# Altium schematic sheet Controller_Sheet.SchDoc
size A4; DocumentNumber: 3; SheetNumber: 3; SheetTotal: 4
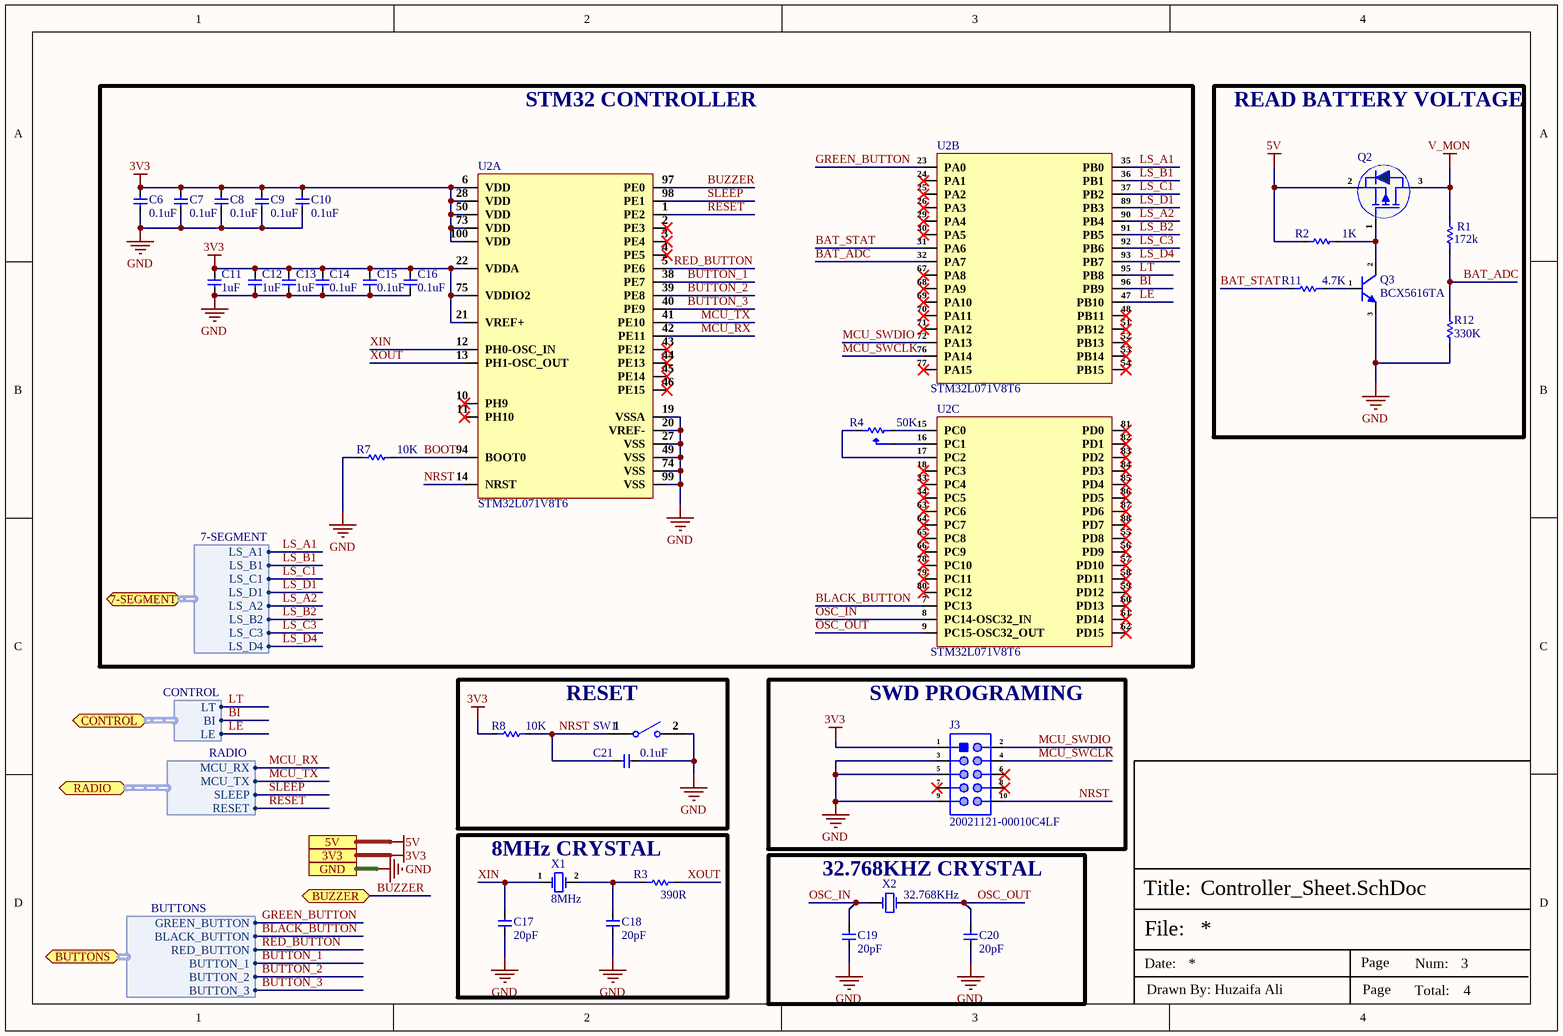
[diagram p0: Controller_Sheet.SchDoc]

## Parts
C6  0.1uF  [Cap-0805]
C7  0.1uF  [Cap-0805]
C8  0.1uF  [Cap-0805]
C9  0.1uF  [Cap-0805]
C10  0.1uF  [Cap-0805]
C11  1uF  [Cap-0805]
C12  1uF  [Cap-0805]
C13  1uF  [Cap-0805]
C14  0.1uF  [Cap-0805]
C15  0.1uF  [Cap-0805]
C16  0.1uF  [Cap-0805]
C17  20pF  [Cap-0805]
C18  20pF  [Cap-0805]
C19  20pF  [Cap-0805]
C20  20pF  [Cap-0805]
C21  0.1uF  [Cap-0805]
J3  20021121-00010C4LF  [20021121-00010C4LF_]
Q2  AO3407  [SOT-23]  (value not drawn)
Q3  BCX5616TA  [SOT-89-3]
R1  172k  [Res-0603]
R2  1K  [Res-0603]
R3  390R  [RES-0805]
R4  50K  [RV4NAYSD503A]
R7  10K  [RES-0805]
R8  10K  [RES-0805]
R11  4.7K  [Res-0603]
R12  330K  [Res-0603]
SW1  B3U-1000P  [B3U-1000P]  (value not drawn)
U2  STM32L071V8T6  [LQFP-100]  (parts A,B,C of 3)
X1  8MHz  [SMD5032-2P]
X2  32.768KHz  [MU00525-32.768K]

## Blocks framed on the sheet
STM32 CONTROLLER: C6-C16 R4 R7 U2
READ BATTERY VOLTAGE: Q2 Q3 R1 R2 R11 R12
RESET: C21 R8 SW1
SWD PROGRAMING: J3
8MHz CRYSTAL: C17 C18 R3 X1
32.768KHZ CRYSTAL: C19 C20 X2

## Ports
3V3 (see Top_Sheet[2B], Peripheral_Sheet[2D], Power_Sheet[1C]), 5V (see Top_Sheet[2B], Peripheral_Sheet[2D], Power_Sheet[1C]), 7-SEGMENT (bidir, harness 7-SEGMENT, see Top_Sheet[2B], Peripheral_Sheet[1C]), BUTTONS (bidir, harness BUTTONS, see Top_Sheet[2B], Peripheral_Sheet[1C]), BUZZER (bidir, see Top_Sheet[2C], Peripheral_Sheet[2D]), CONTROL (bidir, harness CONTROL, see Top_Sheet[2C], Peripheral_Sheet[1D]), GND (see Top_Sheet[2C], Peripheral_Sheet[2D], Power_Sheet[1C]), RADIO (bidir, harness RADIO, see Top_Sheet[2B], Peripheral_Sheet[1D])

## Harnesses
BUTTONS: GREEN_BUTTON, BLACK_BUTTON, RED_BUTTON, BUTTON_1, BUTTON_2, BUTTON_3
RADIO: MCU_RX, MCU_TX, SLEEP, RESET
7-SEGMENT: LS_A1, LS_B1, LS_C1, LS_D1, LS_A2, LS_B2, LS_C3, LS_D4
CONTROL: LT, BI, LE

## Nets
3V3: C6.2 C7.2 C8.2 C9.2 C10.2 C11.2 C12.2 C13.2 C14.2 C15.2 C16.2 J3.1 R8.1 U2.6(VDD) U2.21(VREF+) U2.22(VDDA) U2.28(VDD) U2.50(VDD) U2.73(VDD) U2.75(VDDIO2) U2.100(VDD) ; port 3V3
5V: Q2.2(S) R2.1 ; port 5V
GND: C6.1 C7.1 C8.1 C9.1 C10.1 C11.1 C12.1 C13.1 C14.1 C15.1 C16.1 C17.1 C18.1 C19.1 C20.1 C21.1 J3.3 J3.5 J3.9 Q3.3(E) R7.1 R12.1 SW1.2 U2.19(VSSA) U2.20(VREF-) U2.27(VSS) U2.49(VSS) U2.74(VSS) U2.99(VSS) ; port GND
V_MON: Q2.3(D) R1.2
BAT_ADC: R1.1 R12.2 U2.32(PA7)
BAT_STAT: R11.1 U2.31(PA6)
BI: U2.96(PB9) ; port CONTROL.BI
BLACK_BUTTON: U2.7(PC13) ; port BUTTONS.BLACK_BUTTON
BOOT: R7.2 U2.94(BOOT0)
BUTTON_1: U2.38(PE7) ; port BUTTONS.BUTTON_1
BUTTON_2: U2.39(PE8) ; port BUTTONS.BUTTON_2
BUTTON_3: U2.40(PE9) ; port BUTTONS.BUTTON_3
BUZZER: U2.97(PE0) ; port BUZZER
GREEN_BUTTON: U2.23(PA0) ; port BUTTONS.GREEN_BUTTON
LE: U2.47(PB10) ; port CONTROL.LE
LS_A1: U2.35(PB0) ; port 7-SEGMENT.LS_A1
LS_A2: U2.90(PB4) ; port 7-SEGMENT.LS_A2
LS_B1: U2.36(PB1) ; port 7-SEGMENT.LS_B1
LS_B2: U2.91(PB5) ; port 7-SEGMENT.LS_B2
LS_C1: U2.37(PB2) ; port 7-SEGMENT.LS_C1
LS_C3: U2.92(PB6) ; port 7-SEGMENT.LS_C3
LS_D1: U2.89(PB3) ; port 7-SEGMENT.LS_D1
LS_D4: U2.93(PB7) ; port 7-SEGMENT.LS_D4
LT: U2.95(PB8) ; port CONTROL.LT
MCU_RX: U2.42(PE11) ; port RADIO.MCU_RX
MCU_SWCLK: J3.4 U2.76(PA14)
MCU_SWDIO: J3.2 U2.72(PA13)
MCU_TX: U2.41(PE10) ; port RADIO.MCU_TX
NRST: C21.2 J3.10 R8.2 SW1.1 U2.14(NRST)
OSC_IN: C19.2 U2.8(PC14-OSC32_IN) X2.2(OSC2)
OSC_OUT: C20.2 U2.9(PC15-OSC32_OUT) X2.1(OSC1)
RED_BUTTON: U2.5(PE6) ; port BUTTONS.RED_BUTTON
RESET: U2.1(PE2) ; port RADIO.RESET
SLEEP: U2.98(PE1) ; port RADIO.SLEEP
XIN: C17.2 U2.12(PH0-OSC_IN) X1.1(OSC1)
XOUT: R3.2 U2.13(PH1-OSC_OUT)
NetC18_2: C18.2 R3.1 X1.2(OSC2)
NetQ2_1: Q2.1(G) Q3.2(C) R2.2
NetQ3_1: Q3.1(B) R11.2
NetR4_1: R4.1 U2.15(PC0)
NetR4_2: R4.2(CW) U2.16(PC1)
NetR4_3: R4.3 U2.17(PC2)

Not connected (* = marked no-connect by the designer): J3 6* 7* 8*; U2 2(PE3)* 3(PE4)* 4(PE5)* 10(PH9)* 11(PH10)* 18(PC3)* 24(PA1)* 25(PA2)* 26(PA3)* 29(PA4)* 30(PA5)* 33(PC4)* 34(PC5)* 43(PE12)* 44(PE13)* 45(PE14)* 46(PE15)* 48(PB11)* 51(PB12)* 52(PB13)* 53(PB14)* 54(PB15)* 55(PD8)* 56(PD9)* 57(PD10)* 58(PD11)* 59(PD12)* 60(PD13)* 61(PD14)* 62(PD15)* 63(PC6)* 64(PC7)* 65(PC8)* 66(PC9)* 67(PA8)* 68(PA9)* 69(PA10)* 70(PA11)* 71(PA12)* 77(PA15)* 78(PC10)* 79(PC11)* 80(PC12)* 81(PD0)* 82(PD1)* 83(PD2)* 84(PD3)* 85(PD4)* 86(PD5)* 87(PD6)* 88(PD7)*

## Notes on the sheet
- File:
- Title:
- Date:
- Page
- Num:
- Total:
- Drawn By: Huzaifa Ali

## Library data of the parts
C6-C10 C14-C16 C21 = CL21B104KBCNNNC: Multilayer Ceramic Capacitor, 0.1 uF, 50 V, ± 10%, X7R, 0805 [2012 Metric]; Manufacturer: Samsung; Value: 100nF; Voltage Rating: 50V; Supplier: Digikey; Supplier Part Number: 1276-1003-1-ND; Manufacturer Part Number: CL21B104KBCNNNC; RoHS: Yes; Category: Ceramic Capacitors; Stock: 2193973; Pricing: 1=0.1, 10=0.042, 50=0.024, 100=0.0186, 500=0.01404, 1000=0.01103 (USD); Mounting Technology: Surface Mount; Case/Package: 0805; Case Code (Metric): 2012; Case Code (Imperial): 0805; Material: Ceramic; Min Operating Temperature: -55°C; Max Operating Temperature: 125°C; Tolerance: 10%; Dielectric: X7R; Packaging: Tape and Reel; Voltage: 50V; Series: CL; Construction: Flat; Voltage Rating (DC): 50V; Length: 2mm; Width: 0.049inch; Height: 0.85mm; Depth: 1.25mm; Thickness: 0.037inch; Radiation Hardening: No; RoHS Compliant: Yes; Lead Free: 5697LeadFree; ComponentLink1URL: https://datasheet.ciiva.com/25710/cl21b104kbcnnnc-25710182.pdf?src-supplier=Digikey; ComponentLink1Description: https://datasheet.ciiva.com/25710/cl21b104kbcnnnc-25710182.pdf?src-supplier=Digikey; ComponentLink2URL: https://datasheet.ciiva.com/29199/454152-da-01-en-vs-kondensator-0805-29199814.pdf?src-supplier=Conrad; ComponentLink2Description: https://datasheet.ciiva.com/29199/454152-da-01-en-vs-kondensator-0805-29199814.pdf?src-supplier=Conrad; Item Type: Capacitor
C11-C13 = CL21B105KAFNNNE: Multilayer Ceramic Capacitor, 1 uF, 25 V, ± 10%, X7R, 0805 [2012 Metric]; Manufacturer: Samsung; Voltage: 25V; Supplier: Digikey; Supplier Part Number: 1276-1066-1-ND; Manufacturer Part Number: CL21B105KAFNNNE; RoHS: Yes; Category: Ceramic Capacitors; Stock: 911796; Pricing: 1=0.1, 10=0.062, 50=0.0356, 100=0.0276, 500=0.02078, 1000=0.01633 (USD); Mounting Technology: Surface Mount; Case/Package: 0805; Case Code (Metric): 2012; Case Code (Imperial): 0805; Min Operating Temperature: -55°C; Max Operating Temperature: 125°C; Value: 1uF; Tolerance: 10%; Dielectric: X7R; Voltage Rating (DC): 25V; Series: CL; Packaging: Tape and Reel; Voltage Rating: 25V; Package Quantity: 1; Construction: Flat; Length: 2mm; Width: 0.049inch; Height: 1.25mm; Depth: 1.25mm; Thickness: 0.053inch; Radiation Hardening: No; Lead Free: Lead Free; RoHS Compliant: Yes; ComponentLink1URL: https://datasheet.ciiva.com/25800/cl21b105kafnnne-25800163.pdf?src-supplier=Digikey; ComponentLink1Description: https://datasheet.ciiva.com/25800/cl21b105kafnnne-25800163.pdf?src-supplier=Digikey; ComponentLink2URL: https://datasheet.ciiva.com/15195/getdatasheetpartid-355205-15195880.pdf?src-supplier=Verical; ComponentLink2Description: https://datasheet.ciiva.com/15195/getdatasheetpartid-355205-15195880.pdf?src-supplier=Verical; Item Type: Capacitor
C17-C20 = C0805C200J5HAC7800: Cap Cer 0805 20PF 50V Ultra Stab; Manufacturer: KEMET; Item Type: Capacitor; Supplier: Digikey; Supplier Part Number: 399-C0805C200J5HAC7800CT-ND; Manufacturer Part Number: C0805C200J5HAC7800; RoHS: Yes; Category: Ceramic Capacitors; Stock: 20467; Pricing: 1=0.1, 10=0.069, 50=0.0394, 100=0.0305, 500=0.02298, 1000=0.01805 (USD); Package: 0805
J3 = 20021121-00010C4LF: CONN HEADER SMD 10POS 1.27MM; Manufacturer: Amphenol FCI; Number of Contacts: 10; Contact Resistance: 30mR; Current Rating: 1A; Voltage Rating: 125V; Insulation Resistance: 100MR; Gender: Male; Connector Type: Male Pin,Header; Row Spacing: 0.05inch; Stack Height: 3mm; Item Type: Jtag Male Header; Supplier 1: Digi-Key; Manufacturer Part Number: 20021121-00010C4LF; Stock 1: 0; Pricing 1: 1=0.87, 10=0.761, 100=0.6563 (USD); Mount: Surface Mount; Contact Plating: Gold; Contact Material: Copper Alloy,Copper,Gold; Color: Black; Housing Color: Black; Housing Material: Thermoplastic; Min Operating Temperature: -40°C; Max Operating Temperature: 85°C; Number of Rows: 2; Termination: Solder; Packaging: Tape and Reel; Package Quantity: 600; Number of Positions: 10; Max Voltage Rating (AC): 125V; Orientation: Straight; Length: 6.35mm; Pitch: 1.27mm; Contact Mating Length: 0.12inch; Depth: 3.4mm; Radiation Hardening: No; REACH SVHC: No SVHC; ComponentLink1URL: https://www.verical.com/server-webapp/html/getDatasheet?partID=177140&src-supplier=Verical; ComponentLink1Description: https://www.verical.com/server-webapp/html/getDatasheet?partID=177140&src-supplier=Verical; ComponentLink2URL: http://portal.fciconnect.com/Comergent/fci/drawing/20021121.pdf?src-supplier=Avnet; ComponentLink2Description: http://portal.fciconnect.com/Comergent/fci/drawing/20021121.pdf?src-supplier=Avnet; ComponentLink3URL: https://cdn.amphenol-icc.com/media/wysiwyg/files/drawing/20021121.pdf?src-supplier=Digi-Key; ComponentLink3Description: https://cdn.amphenol-icc.com/media/wysiwyg/files/drawing/20021121.pdf?src-supplier=Digi-Key; ComponentLink4URL: http://portal.fciconnect.com/Comergent/fci/drawing/20021121.pdf?src-supplier=Avnet+Europe; ComponentLink4Description: http://portal.fciconnect.com/Comergent/fci/drawing/20021121.pdf?src-supplier=Avnet+Europe; ComponentLink5URL: https://media.digikey.com/pdf/Data%20Sheets/FCI%20PDFs/Minitek%20127_Catalog.pdf?src-supplier=Digi-Key; ComponentLink5Description: https://media.digikey.com/pdf/Data%20Sheets/FCI%20PDFs/Minitek%20127_Catalog.pdf?src-supplier=Digi-Key; ComponentLink6URL: http://portal.fciconnect.com/Comergent//fci/drawing/20021121.pdf?src-supplier=Mouser; ComponentLink6Description: http://portal.fciconnect.com/Comergent//fci/drawing/20021121.pdf?src-supplier=Mouser; Supplier Part Number 1: 609-3695-6-ND; LCSC Part Number: C150517
Q2 = AO3407: 30V 4.1A 60mΩ@10V,4.1A 350mW 3V@250uA P Channel SOT-23 MOSFETs ROHS; Manufacturer: Guangdong Hottech; Item Type: Mosfet; Manufacturer Part Number: AO3407; Package: SOT-23; LCSC Part Number: C181093; ComponentLink1Description: LCSC; ComponentLink1URL: https://www.lcsc.com/product-detail/MOSFETs_Guangdong-Hottech-AO3407_C181093.html
Q3 = BCX5616TA: TRANS NPN 80V 1A SOT89-3; Manufacturer: Diodes; Item Type: Transistor; Supplier: Future Electronics; Supplier Part Number: 8266140; Manufacturer Part Number: BCX5616TA; RoHS: Yes; Category: BJTs; Stock: 564000; Pricing: 1000=0.0584, 4000=0.0557, 15000=0.0532, 25000=0.0523, 30000=0.0434, 50000=0.0494, 75000=0.0411 (USD); ComponentLink1URL: http://www.farnell.com/datasheets/2238091.pdf?src-supplier=Farnell; ComponentLink1Description: http://www.farnell.com/datasheets/2238091.pdf?src-supplier=Farnell; ComponentLink2URL: https://datasheet.octopart.com/BCX5616TA-Zetex-datasheet-93265.pdf?src-supplier=Digi-Key; ComponentLink2Description: https://datasheet.octopart.com/BCX5616TA-Zetex-datasheet-93265.pdf?src-supplier=Digi-Key; ComponentLink3URL: https://datasheet.octopart.com/BCX5616TA-Diodes-Inc.-datasheet-62305054.pdf?src-supplier=Future+Electronics; ComponentLink3Description: https://datasheet.octopart.com/BCX5616TA-Diodes-Inc.-datasheet-62305054.pdf?src-supplier=Future+Electronics; ComponentLink4URL: https://datasheet.octopart.com/BCX5616TA-Diodes-Inc.-datasheet-79809.pdf?src-supplier=Newark; ComponentLink4Description: https://datasheet.octopart.com/BCX5616TA-Diodes-Inc.-datasheet-79809.pdf?src-supplier=Newark; LCSC Part Number: C435873
R1 = RT0603BRD07172KL: RES 172K OHM 0.1% 1/10W 0603; Manufacturer: Yageo; Resistance: 172kR; Max Power Dissipation: 100mW; Temperature Coefficient: 25ppm/°C; Item Type: Resistor; Supplier 1: Mouser; Manufacturer Part Number: RT0603BRD07172KL; RoHS: Yes; Category: Chip SMD Resistors; Stock 1: 2756; Pricing 1: 1=0.33000, 10=0.27400, 50=0.27400, 100=0.10800, 1000=0.04500, 10000=0.03400 (USD); Case/Package: 0603; Min Operating Temperature: -55°C; Max Operating Temperature: 155°C; Resistor Type: Thin Film; Packaging: Tape and Reel; Tolerance: 0.1%; Number of Terminations: 2; RoHS Compliant: Yes; ComponentLink1URL: http://www.yageo.com/documents/recent/PYu-RT_1-to-0.01_RoHS_L_9.pdf?src-supplier=Digi-Key; ComponentLink1Description: http://www.yageo.com/documents/recent/PYu-RT_1-to-0.01_RoHS_L_9.pdf?src-supplier=Digi-Key; Supplier Part Number 1: 603-RT0603BRD07172KL; LCSC Part Number: C861162
R2 = RC0603FR-071KL: RES SMD 1K OHM 1% 1/10W 0603; Manufacturer: Yageo; Resistance: 1kR; Temperature Coefficient: 100ppm/°C; Power Rating: 100mW; Voltage Rating: 50V; Item type: Resistor; ComponentLink1URL: https://www.verical.com/server-webapp/html/getDatasheet?partID=409289&src-supplier=Verical; ComponentLink1Description: https://www.verical.com/server-webapp/html/getDatasheet?partID=409289&src-supplier=Verical; Supplier 1: Digi-Key; Manufacturer Part Number: RC0603FR-071KL; Stock 1: 21472395; Pricing 1: 1=0.1, 10=0.023, 100=0.0094, 1000=0.0042, 2500=0.0037 (USD); Case/Package: 0603; Contact Plating: Tin,Matte; Case Code (Imperial): 0603; Case Code (Metric): 1608; Min Operating Temperature: -55°C; Max Operating Temperature: 155°C; Tolerance: 1%; Composition: Thick Film; Packaging: Tape and Reel; Termination: SMD/SMT; Military Standard: Not; Length: 1.6mm; Height: 0.45mm; Depth: 0.8mm; Radiation Hardening: No; REACH SVHC: No SVHC; Lead Free: Lead Free; ComponentLink2URL: http://documents.rs-components.com/techlib://itc_doclist_GB.htm?stockno=5048928&src-supplier=RSComponents; ComponentLink2Description: http://documents.rs-components.com/techlib://itc_doclist_GB.htm?stockno=5048928&src-supplier=RSComponents; ComponentLink3URL: http://www.yageo.com/documents/recent/PYu-RC0603_51_RoHS_L_4.pdf?src-supplier=Avnet+Europe; ComponentLink3Description: http://www.yageo.com/documents/recent/PYu-RC0603_51_RoHS_L_4.pdf?src-supplier=Avnet+Europe; ComponentLink4URL: http://www.farnell.com/datasheets/2167052.pdf?src-supplier=Element14; ComponentLink4Description: http://www.farnell.com/datasheets/2167052.pdf?src-supplier=Element14; ComponentLink5URL: http://www.farnell.com/datasheets/1868787.pdf?src-supplier=Element14; ComponentLink5Description: http://www.farnell.com/datasheets/1868787.pdf?src-supplier=Element14; ComponentLink6URL: http://www.yageo.com/documents/recent/PYu-RC_Group_51_RoHS_L_2.pdf?src-supplier=Avnet; ComponentLink6Description: http://www.yageo.com/documents/recent/PYu-RC_Group_51_RoHS_L_2.pdf?src-supplier=Avnet; ComponentLink7URL: https://www.verical.com/server-webapp/html/getDatasheet?partID=404327&src-supplier=Verical; ComponentLink7Description: https://www.verical.com/server-webapp/html/getDatasheet?partID=404327&src-supplier=Verical; ComponentLink8URL: http://www.farnell.com/datasheets/443971.pdf?src-supplier=Element14; ComponentLink8Description: http://www.farnell.com/datasheets/443971.pdf?src-supplier=Element14; Supplier Part Number 1: 311-1.00KHRDKR-ND; LCSC Part Number: C22548
R3 = CPF0805B390RE1: Res Thin Film 0805 390 Ohm 0.1% 1/10W ±25ppm/°C Molded SMD SMD Paper T/R; Manufacturer: TE Connectivity Neohm; Supplier: Digikey; Supplier Part Number: A103202CT-ND; Manufacturer Part Number: CPF0805B390RE1; RoHS: Yes; Category: Chip SMD Resistors; Stock: 3823; Pricing: 1=0.39, 10=0.283, 50=0.2188, 100=0.1943, 500=0.14536 (USD); ComponentLink1URL: https://datasheet.ciiva.com/7943/eng-ds-1773200-j-7943773.pdf?src-supplier=Element14; ComponentLink1Description: https://datasheet.ciiva.com/7943/eng-ds-1773200-j-7943773.pdf?src-supplier=Element14; ComponentLink2URL: https://datasheet.ciiva.com/7943/eng-ds-1773200-j-7943799.pdf?src-supplier=Element14; ComponentLink2Description: https://datasheet.ciiva.com/7943/eng-ds-1773200-j-7943799.pdf?src-supplier=Element14
R4 = RV4NAYSD503A: Potentiometer RV4 Series 1 Turn 50K Ohms 10% Tol Power 2W Slotted 0.875 In Shaft; Manufacturer: Precision Electronic Components; Value: 50kR; Number of Turns: 1; Voltage Rating (DC): 500V; Actuator Length: 0.875inch; Actuator Diameter: 0.249inch; Supplier: Digikey; Supplier Part Number: RV4N503C-ND; Manufacturer Part Number: RV4NAYSD503A; RoHS: Yes; Category: Variable Resistors and Potentiometers; Stock: 1093; Pricing: 1=18.17, 10=16.774, 25=16.0752, 50=13.9784, 100=12.5806, 250=10.83328, 500=10.4838, 1000=9.78488 (USD); Mounting Technology: Panel; Housing Material: Stainless Steel; Tolerance: 10%; Packaging: Bulk; Taper: Linear; Termination: Solder; Number of Gangs: 1; Resistor Type: Carbon; Package Quantity: 100; Max Power Dissipation: 2W; Series: RV4; Diameter: 28.4mm; Length: 13.6mm; Reach SVHC Compliant: Yes; Lead Free: Lead Free; ComponentLink1URL: https://datasheet.ciiva.com/2152/milstylerv4-2152739.pdf?src-supplier=Digikey; ComponentLink1Description: https://datasheet.ciiva.com/2152/milstylerv4-2152739.pdf?src-supplier=Digikey; Item Type: Potentiometer; Package: Custom
R7 R8 = AC0805JR-0710KL: SMD Chip Resistor, 10 kOhm, ± 5%, 125 mW, 0805 [2012 Metric], Thick Film, General Purpose; Manufacturer: Yageo; Power Rating: 125mW; Value: 10kR; Voltage Rating: 150V; Temperature Coefficient: 100ppm/°C; Supplier: Digikey; Supplier Part Number: YAG3758CT-ND; Manufacturer Part Number: AC0805JR-0710KL; RoHS: Yes; Category: Chip SMD Resistors; Stock: 109979; Pricing: 1=0.1, 10=0.027, 50=0.0174, 100=0.0146, 500=0.01004, 1000=0.00868 (USD); Case/Package: 0805; Case Code (Imperial): 0805; Case Code (Metric): 2012; Min Operating Temperature: -55°C; Max Operating Temperature: 155°C; Termination: SMD/SMT; Packaging: Tape and Reel; Tolerance: 5%; Number of Terminations: 2; Max Power Dissipation: 125mW; Features: Moisture Resistant,Automotive AEC-Q200; Series: AC; Length: 0.079inch; Width: 1.25mm; Height: 0.024inch; Lead Free: Lead Free; RoHS Compliant: Yes; ComponentLink1URL: http://www.mouser.com/ds/2/447/yageodocoutput-1111992.pdf?src-supplier=Mouser; ComponentLink1Description: http://www.mouser.com/ds/2/447/yageodocoutput-1111992.pdf?src-supplier=Mouser; ComponentLink2URL: https://datasheet.octopart.com/AC0805JR-0710KL-Yageo-datasheet-151884373.pdf?src-supplier=Future+Electronics; ComponentLink2Description: https://datasheet.octopart.com/AC0805JR-0710KL-Yageo-datasheet-151884373.pdf?src-supplier=Future+Electronics; ComponentLink3URL: http://www.yageo.com/NewPortal/yageodocoutput?fileName=/pdf/R-Chip/PYu-AC_51_RoHS_L_6.pdf&src-supplier=Digikey; ComponentLink3Description: http://www.yageo.com/NewPortal/yageodocoutput?fileName=/pdf/R-Chip/PYu-AC_51_RoHS_L_6.pdf&src-supplier=Digikey; ComponentLink4URL: https://www.yageo.com/upload/media/product/productsearch/datasheet/rchip/PYu-AC_51_RoHS_L_7.pdf?src-supplier=Digikey; ComponentLink4Description: https://www.yageo.com/upload/media/product/productsearch/datasheet/rchip/PYu-AC_51_RoHS_L_7.pdf?src-supplier=Digikey; Item Type: Resistor; Package: 0805
R11 = RC0603JR-074K7L: RES SMD 4.7K OHM 5% 1/10W 0603; Manufacturer: Yageo; Resistance: 4.7kR; Temperature Coefficient: 100ppm/°C; Voltage Rating (DC): 50V; Power Rating: 100mW; Item Type: Resistor; Supplier 1: Digi-Key; Manufacturer Part Number: RC0603JR-074K7L; Stock 1: 19706643; Pricing 1: 1=0.1, 10=0.02, 100=0.0081, 1000=0.00362, 2500=0.00314 (USD); Case/Package: 0603; Number of Pins: 2; Case Code (Imperial): 0603; Case Code (Metric): 1608; Min Operating Temperature: -55°C; Max Operating Temperature: 155°C; Tolerance: 5%; Composition: Thick Film; Packaging: Tape and Reel; Voltage Rating: 50V; Termination: SMD/SMT; Military Standard: Not; Length: 1.6mm; Width: 0.8mm; Depth: 0.8mm; REACH SVHC: No SVHC; Lead Free: Lead Free; ComponentLink1URL: http://www.farnell.com/datasheets/443971.pdf?src-supplier=Element14; ComponentLink1Description: http://www.farnell.com/datasheets/443971.pdf?src-supplier=Element14; Supplier Part Number 1: 311-4.7KGRCT-ND; LCSC Part Number: C105428
R12 = RC0603FR-07330KL: RES 330K OHM 1% 1/10W 0603; Manufacturer: Yageo; Power Rating: 100mW; Value: 330kR; Voltage Rating (DC): 50V; Temperature Coefficient: 100ppm/°C; Voltage Rating: 75V; Item Type: Resistor; Supplier 1: Future Electronics; Manufacturer Part Number: RC0603FR-07330KL; RoHS: Yes; Category: Chip SMD Resistors; Stock 1: 1500000; Pricing 1: 5000=0.0014, 50000=0.0013, 75000=0.0015, 200000=0.0012, 250000=0.0014, 625000=0.0012, 750000=0.0013, 2000000=0.0011, 2500000=0.0012 (USD); Case/Package: 0603; Pins: 2; Case Code (Imperial): 0603; Case Code (Metric): 1608; Weight: 7.1E-05oz; Min Operating Temperature: -55°C; Max Operating Temperature: 155°C; Tolerance: 1%; Packaging: Tape and Reel; Resistor Type: Thick Film; Number of Terminations: 2; Termination: SMD/SMT; Max Power Dissipation: 100mW; Features: Moisture Resistant; Series: RC; Resistance Tolerance: 1%; Construction: Rectangular; Length: 1.6mm; Width: 0.8mm; Height: 0.45mm; Depth: 0.8mm; Reach SVHC Compliant: No; Lead Free: Lead Free; Military Standard: Not; RoHS Compliant: Yes; ComponentLink1URL: https://datasheet.ciiva.com/2455/pyu-r-int-thick-7-2455366.pdf?src-supplier=Digi-Key; ComponentLink1Description: https://datasheet.ciiva.com/2455/pyu-r-int-thick-7-2455366.pdf?src-supplier=Digi-Key; ComponentLink2URL: https://datasheet.ciiva.com/2455/pyu-r-int-thick-7-2455367.pdf?src-supplier=Digi-Key; ComponentLink2Description: https://datasheet.ciiva.com/2455/pyu-r-int-thick-7-2455367.pdf?src-supplier=Digi-Key; ComponentLink3URL: https://datasheet.ciiva.com/2455/pyu-r-int-thick-7-2455365.pdf?src-supplier=Digi-Key; ComponentLink3Description: https://datasheet.ciiva.com/2455/pyu-r-int-thick-7-2455365.pdf?src-supplier=Digi-Key; ComponentLink4URL: https://datasheet.ciiva.com/7746/443971-7746328.pdf?src-supplier=Element14; ComponentLink4Description: https://datasheet.ciiva.com/7746/443971-7746328.pdf?src-supplier=Element14; ComponentLink5URL: https://datasheet.ciiva.com/7746/443971-7746327.pdf?src-supplier=Element14; ComponentLink5Description: https://datasheet.ciiva.com/7746/443971-7746327.pdf?src-supplier=Element14; ComponentLink6URL: https://datasheet.ciiva.com/15189/getdatasheetpartid-323788-15189703.pdf?src-supplier=Verical; ComponentLink6Description: https://datasheet.ciiva.com/15189/getdatasheetpartid-323788-15189703.pdf?src-supplier=Verical; Supplier Part Number 1: 9008384; LCSC Part Number: C114618
SW1 = B3U-1000P: SWITCH TACTILE SPST-NO 0.05A 12V; Manufacturer: Omron; Mechanical Life: 200000Cycles; Operating Force: 1.5N; Throw Configuration: SPST; Current Rating: 50mA; Contact Resistance: 100mR; Illumination Type: Non-Illuminated,Illuminated; Switch Travel: 0.15mm; Switch Function: Off-Mom; Actuator Type: Standard; Actuator Length: 0.4mm; Ratings: Dust Proof,IP40; ComponentLink1URL: http://www.farnell.com/datasheets/60838.pdf?src-supplier=Farnell; ComponentLink1Description: http://www.farnell.com/datasheets/60838.pdf?src-supplier=Farnell; ComponentLink2URL: http://www.farnell.com/datasheets/60838.pdf?src-supplier=Element14; ComponentLink2Description: http://www.farnell.com/datasheets/60838.pdf?src-supplier=Element14; ComponentLink3URL: https://omronfs.omron.com/en_US/ecb/products/pdf/en-b3u.pdf?src-supplier=Digi-Key; ComponentLink3Description: https://omronfs.omron.com/en_US/ecb/products/pdf/en-b3u.pdf?src-supplier=Digi-Key; ComponentLink4URL: http://www.omron.com/ecb/products/pdf/en-b3u.pdf?src-supplier=Digi-Key; ComponentLink4Description: http://www.omron.com/ecb/products/pdf/en-b3u.pdf?src-supplier=Digi-Key; ComponentLink5URL: https://www.distrelec.biz/Web/Downloads/he/et/B3U_eng_datasheet.pdf?mime=application%2Fpdf&src-supplier=Distrelec; ComponentLink5Description: https://www.distrelec.biz/Web/Downloads/he/et/B3U_eng_datasheet.pdf?mime=application%2Fpdf&src-supplier=Distrelec; ComponentLink6URL: http://www.onlinecomponents.com/productFiles/mf-OM/en-b3u.pdf?src-supplier=Onlinecomponents.com; ComponentLink6Description: http://www.onlinecomponents.com/productFiles/mf-OM/en-b3u.pdf?src-supplier=Onlinecomponents.com; Supplier 1: Digi-Key; Manufacturer Part Number: B3U-1000P; Stock 1: 116454; Pricing 1: 1=1, 10=0.961, 25=0.9064, 50=0.7976, 100=0.7251, 250=0.68888, 500=0.67074, 1000=0.52571 (USD); Mount: Surface Mount; Weight: 0.000776oz; Contact Material: Silver; Min Operating Temperature: -25°C; Max Operating Temperature: 70°C; Packaging: Tape and Reel; Voltage Rating (DC): 12V; Package Quantity: 1; Max Current Rating: 50mA; Termination: SMD/SMT; Orientation: Straight; Max Voltage Rating (DC): 12V; Electrical Life: 200000Cycles; Insulation Resistance: 100MR; Contact Current Rating: 50mA; Length: 4mm; Height: 1.2mm; Depth: 2.5mm; Width: 3mm; REACH SVHC: Unknown; Lead Free: Lead Free; ComponentLink7URL: https://www.verical.com/server-webapp/html/getDatasheet?partID=552554&src-supplier=Verical; ComponentLink7Description: https://www.verical.com/server-webapp/html/getDatasheet?partID=552554&src-supplier=Verical; ComponentLink8URL: http://www.farnell.com/datasheets/1685550.pdf?src-supplier=Element14; ComponentLink8Description: http://www.farnell.com/datasheets/1685550.pdf?src-supplier=Element14; ComponentLink9URL: http://www.farnell.com/datasheets/2610940.pdf?src-supplier=Farnell; ComponentLink9Description: http://www.farnell.com/datasheets/2610940.pdf?src-supplier=Farnell; ComponentLink10URL: https://www.alliedelec.com/m/d/4c8a9ef82804fc3c241a13c1e298fd73.pdf?src-supplier=Allied+Electronics; ComponentLink10Description: https://www.alliedelec.com/m/d/4c8a9ef82804fc3c241a13c1e298fd73.pdf?src-supplier=Allied+Electronics; Supplier Part Number 1: SW1020DKR-ND; LCSC Part Number: C231329; Item Type: Switch
U2 = STM32L071V8T6: IC MCU 32BIT 64KB FLASH 100LQFP; Manufacturer: STMicroelectronics; Interface: I2C,SPI,IrDA,UART,USART; Peripherals: Brown-out Detect/Reset,POR,PWM,WDT,DMA; Core Architecture: ARM; Number of I/Os: 84; Oscillator Type: Internal; Supplier: Digikey; Supplier Part Number: 497-17920-ND; Manufacturer Part Number: STM32L071V8T6; RoHS: Yes; Category: Microcontrollers; Stock: 394; Pricing: 1=5.13, 10=4.606, 25=4.3544, 80=3.77375, 230=3.58022, 540=3.21254, 1080=2.70936, 2700=2.5739 (USD); Case/Package: LQFP; Min Operating Temperature: -40°C; Max Operating Temperature: 85°C; Memory Format: FLASH; Memory Size: 64KB; Series: STM32L0; Packaging: Tray; RoHS Compliant: Yes; ComponentLink1URL: http://www.st.com/content/ccc/resource/technical/document/datasheet/b5/24/80/11/51/59/47/f7/DM00141136.pdf/files/DM00141136.pdf/jcr:content/translations/en.DM00141136.pdf?src-supplier=Digikey; ComponentLink1Description: http://www.st.com/content/ccc/resource/technical/document/datasheet/b5/24/80/11/51/59/47/f7/DM00141136.pdf/files/DM00141136.pdf/jcr:content/translations/en.DM00141136.pdf?src-supplier=Digikey; LCSC Part Number: C2971584; Item Type: IC; ComponentLink2Description: LCSC; ComponentLink2URL: https://www.lcsc.com/product-detail/Microcontroller-Units-MCUs-MPUs-SOCs_STMicroelectronics-STM32L071V8T6_C2971584.html
X1 = ABM3-8.000MHZ-D2Y-T: 5032 2-SMD 8MHz 18pF ±20ppm -40°C~85°C; Manufacturer: Abracon; ESR (Equivalent Series Resistance): 140R; Frequency Stability: 30ppm; ESR: 500R; Item Type: Crystal; Supplier 1: Future Electronics; Manufacturer Part Number: ABM3-8.000MHZ-D2Y-T; RoHS: Yes; Category: Crystals; Stock 1: 294000; Pricing 1: 1000=0.36500, 2000=0.35500, 3000=0.35000, 4000=0.34500, 5000=0.33500 (USD); Mounting Technology: Surface Mount; Case/Package: SMD/SMT; Pins: 2; Min Operating Temperature: -40°C; Max Operating Temperature: 85°C; Frequency: 8MHz; Tolerance: 20ppm; Load Capacitance: 18pF; Packaging: Cut Tape; Package Quantity: 1000; Frequency Tolerance: 20ppm; Termination: SMD/SMT; Resistor Type: Ceramic; Series: ABM3; Length: 5mm; Width: 3.2mm; Height: 0.051inch; Depth: 3.2mm; Radiation Hardening: No; Lead Free: Lead Free; RoHS Compliant: Yes; ComponentLink1URL: https://datasheet.ciiva.com/862/abm3-862465.pdf?src-supplier=Digi-Key; ComponentLink1Description: https://datasheet.ciiva.com/862/abm3-862465.pdf?src-supplier=Digi-Key; Supplier Part Number 1: 9005104; LCSC Part Number: C144380
X2 = MU00525-32.768K: CRYSTAL 32.7680KHZ 6PF SMD; Manufacturer: NDK; Supplier: Digikey; Supplier Part Number: 644-MU00525-32.768KCT-ND; Manufacturer Part Number: MU00525-32.768K; RoHS: No; Stock: 133793; Pricing: 1=0.72, 10=0.601, 50=0.5408, 100=0.4808, 500=0.45672, 1000=0.38461 (USD); Item Type: Crystal; Package: Custom; LCSC Part Number: -; ComponentLink1Description: Digikey; ComponentLink1URL: https://www.digikey.com/en/products/detail/ndk-america-inc/MU00525-32-768K/9172042?s=N4IgTCBcDaIHIA0DMYCMBWAygQQLQoDoB2ANgA4BpACQC1cBRBTABmbwFkBVV9MdEALoBfIA